# Altium schematic sheet MECHANICAL_FOR_PCB.SchDoc
size A4; SheetNumber: 18; SheetTotal: 20
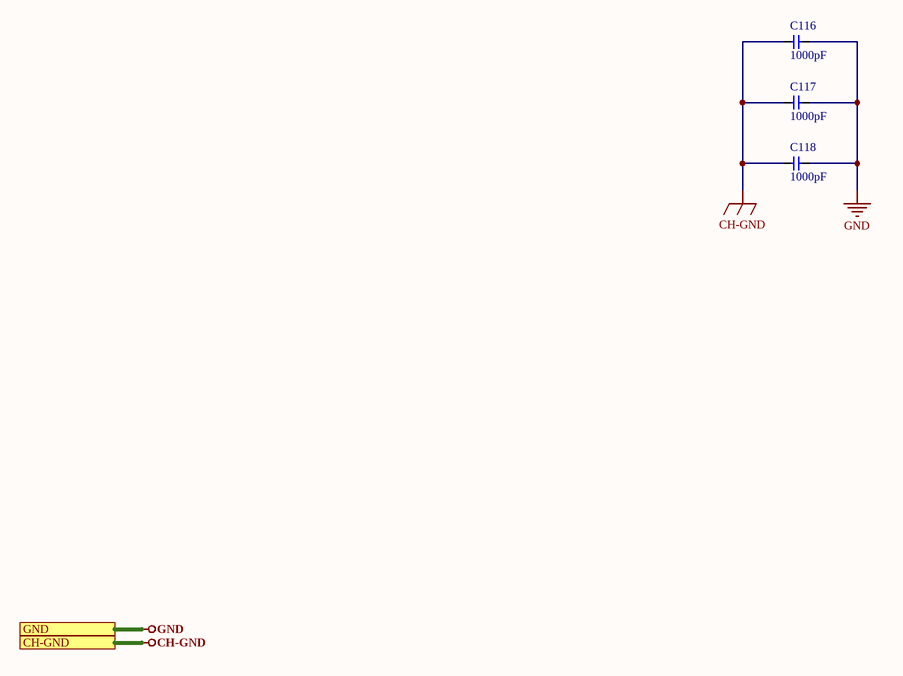
[diagram p0: MECHANICAL_FOR_PCB.SchDoc]

## Parts
C116  1000pF  [Cap-1206]
C117  1000pF  [Cap-1206]
C118  1000pF  [Cap-1206]

## Ports
CH-GND (see Top_Sheet[1D], ETHERNET_INTERFACE[1D], HDMI_INTERFACE[1D], LTE_MODULE[1D], USB3.0_INTERFACE[1D]), GND (see Top_Sheet[1D], 03-CAN2_SPI_CAN_CONTROLLER[1D], APALIS_POWER_SUPPLY[1D], CAN2_SPI_CAN_CONTROLLER[1D], CODEC_INTERFACE[1D], CONNECTORS[1D], DC_DC_CONVERTER[1D], DIGITAL_I-O_O-P[1D], ETHERNET_INTERFACE[1D], FUTURE_USE_CONNECTOR[1D], GPIO_NC_INTERFACE[4B], HDMI_INTERFACE[1D], I2C_INTERFACE[1B], INPUT_SUPPLY_PROTECTION[1D], LTE_MODULE[1D], MICRO_SD_CARD_INTERFACE[1D], Reset_and_SDIO[1D], UART_INTERFACE[1D], USB3.0_INTERFACE[1D])

## Nets
CH-GND: C116.1 C117.1 C118.1 ; port CH-GND
GND: C116.2 C117.2 C118.2 ; port GND

## Library data of the parts
C116-C118 = CL31B102KJHNNNE: CAP CER 1000PF 2KV X7R 1206; Manufacturer: Samsung; Value: 1nF; Tolerance: 10%; Voltage: 200V; Item Type: Capacitor; Supplier: Arrow Electronics; Supplier Part Number: CL31B102KJHNNNE; Manufacturer Part Number: CL31B102KJHNNNE; RoHS: Yes; Category: Ceramic Capacitors; Stock: 125192; Pricing: 1=0.3279, 10=0.1547, 25=0.1532, 100=0.0959, 250=0.095, 500=0.09, 1000=0.0734, 3000=0.0687, 6000=0.0643, 15000=0.0565, 30000=0.0502, 75000=0.0468 (USD); Mounting Technology: Surface Mount; Case/Package: 1206; Case Code (Metric): 3216; Case Code (Imperial): 1206; Min Operating Temperature: -55°C; Max Operating Temperature: 125°C; Packaging: Tape and Reel; Package Quantity: 1; Voltage Rating: 2kV; Dielectric: X7R; Series: CL; Construction: Flat; Length: 3.2mm; Width: 0.063inch; Height: 1.6mm; Thickness: 0.071inch; Depth: 1.6mm; Radiation Hardening: No; RoHS Compliant: Yes; ComponentLink1URL: https://datasheet.ciiva.com/25727/cl31b102kjhnnne-25727529.pdf?src-supplier=Digi-Key; ComponentLink1Description: https://datasheet.ciiva.com/25727/cl31b102kjhnnne-25727529.pdf?src-supplier=Digi-Key; ComponentLink2URL: https://datasheet.ciiva.com/26838/getdatasheetpartid-358436-26838883.pdf?src-supplier=Verical; ComponentLink2Description: https://datasheet.ciiva.com/26838/getdatasheetpartid-358436-26838883.pdf?src-supplier=Verical